# EAGLE design birthday-countdown-clock (EAGLE 9.7.0)
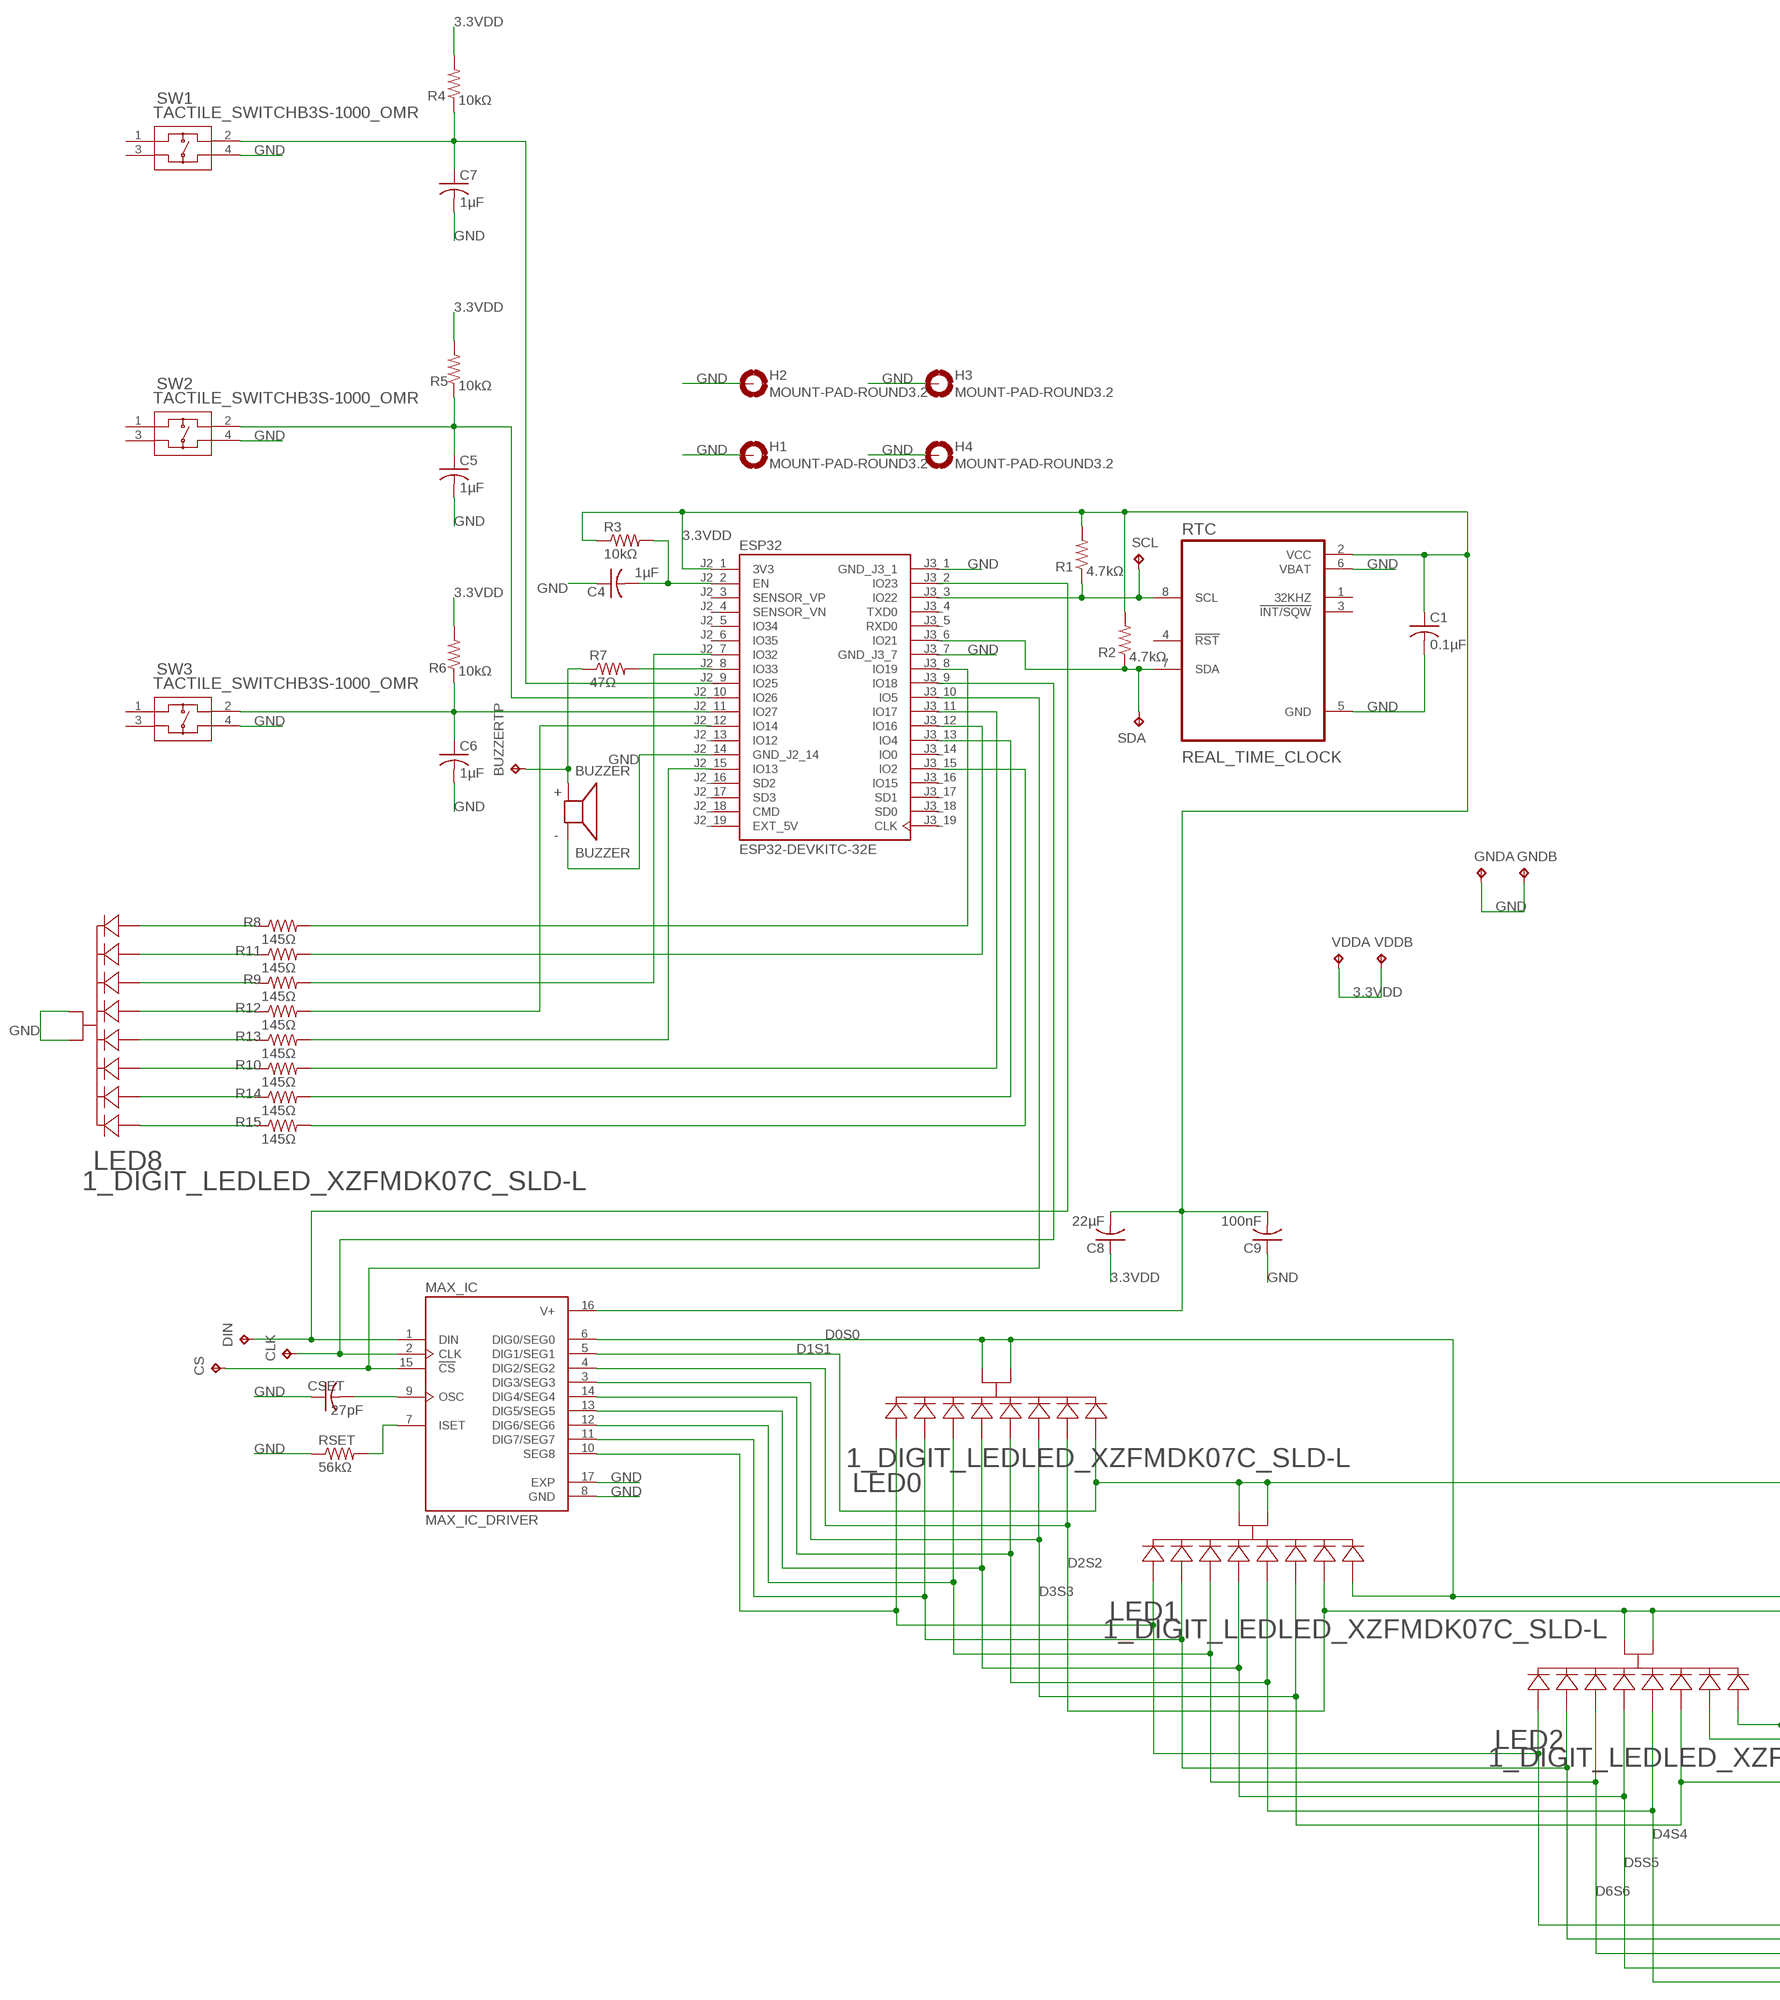
[diagram p0: schematic, sheet 1, part 1 of 2]
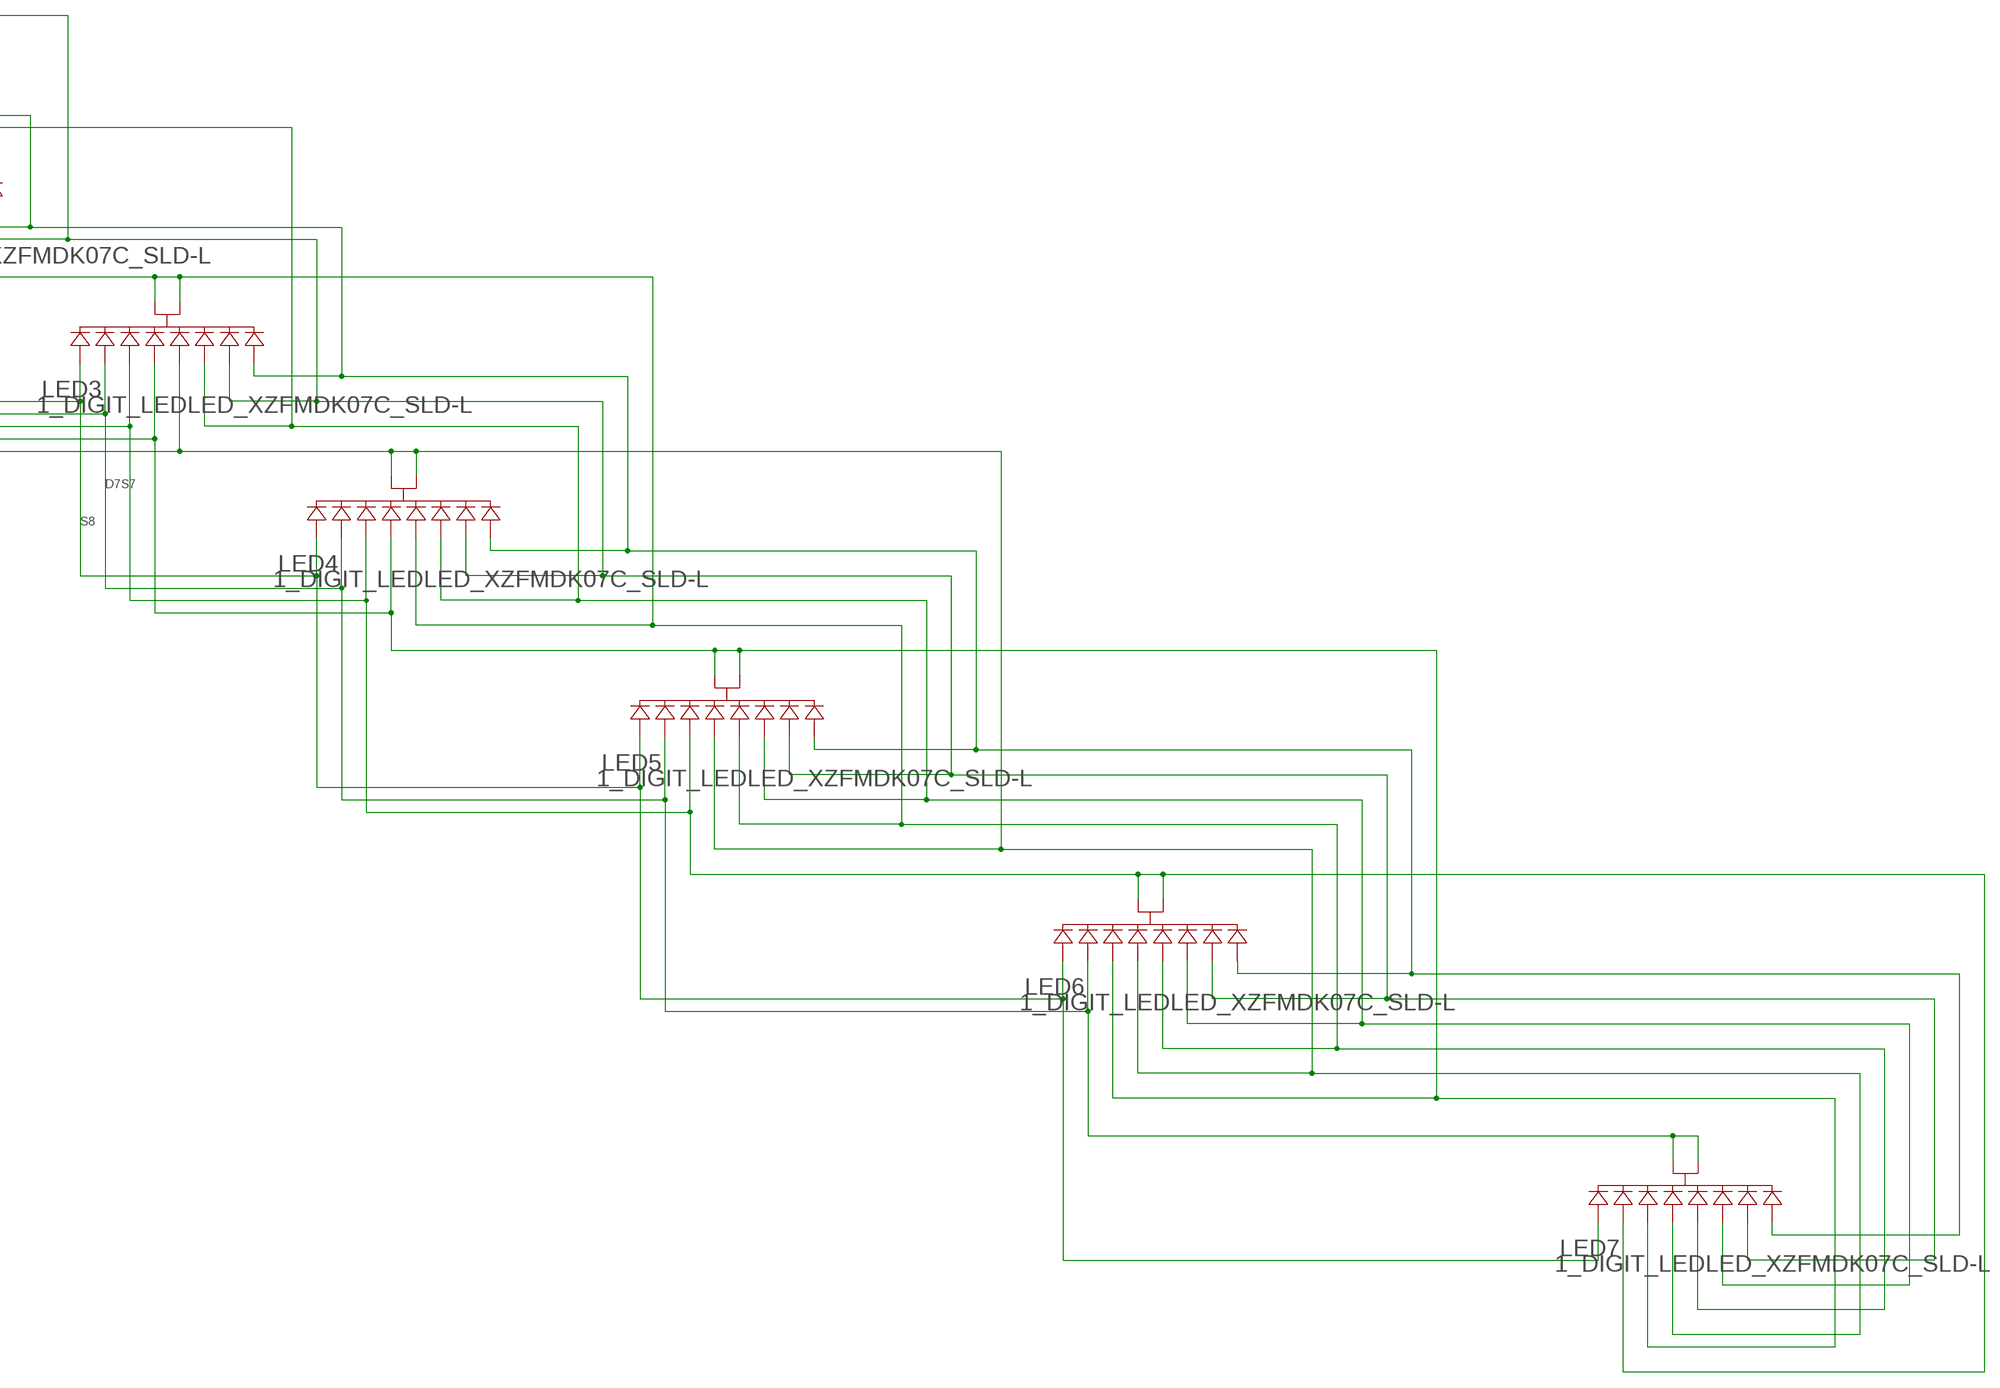
[diagram p1: schematic, sheet 1, part 2 of 2]

## Parts
BUZZER  BUZZER  [XDCR_SMTB-0927-TW-R]
BUZZERTP  TPTP20SQ  [TP20SQ]
C1  0.1µF  C-USC0805  [C0805]
C4  1µF  C-USC0805  [C0805]
C5  1µF  C-USC0805  [C0805]
C6  1µF  C-USC0805  [C0805]
C7  1µF  C-USC0805  [C0805]
C8  22µF  C-USC0805  [C0805]
C9  100nF  C-USC0805  [C0805]
CLK  TPTP20SQ  [TP20SQ]
CS  TPTP20SQ  [TP20SQ]
CSET  27pF  C-USC0805  [C0805]
DIN  TPTP20SQ  [TP20SQ]
ESP32  ESP32-DEVKITC-32E  [MODULE_ESP32-DEVKITC-32E]
GND  TP2P2-38-20  [P2-38-20]
H1  MOUNT-PAD-ROUND3.2  [3,2-PAD]
H2  MOUNT-PAD-ROUND3.2  [3,2-PAD]
H3  MOUNT-PAD-ROUND3.2  [3,2-PAD]
H4  MOUNT-PAD-ROUND3.2  [3,2-PAD]
LED0  1_DIGIT_LEDLED_XZFMDK07C_SLD-L  [LED_XZFMDK07C_SLD-L]
LED1  1_DIGIT_LEDLED_XZFMDK07C_SLD-L  [LED_XZFMDK07C_SLD-L]
LED2  1_DIGIT_LEDLED_XZFMDK07C_SLD-L  [LED_XZFMDK07C_SLD-L]
LED3  1_DIGIT_LEDLED_XZFMDK07C_SLD-L  [LED_XZFMDK07C_SLD-L]
LED4  1_DIGIT_LEDLED_XZFMDK07C_SLD-L  [LED_XZFMDK07C_SLD-L]
LED5  1_DIGIT_LEDLED_XZFMDK07C_SLD-L  [LED_XZFMDK07C_SLD-L]
LED6  1_DIGIT_LEDLED_XZFMDK07C_SLD-L  [LED_XZFMDK07C_SLD-L]
LED7  1_DIGIT_LEDLED_XZFMDK07C_SLD-L  [LED_XZFMDK07C_SLD-L]
LED8  1_DIGIT_LEDLED_XZFMDK07C_SLD-L  [LED_XZFMDK07C_SLD-L]
MAX_IC  MAX_IC_DRIVER  [SOP63P602X173-17N]
R1  4.7kΩ  R-US_R0805  [R0805]
R2  4.7kΩ  R-US_R0805  [R0805]
R3  10kΩ  R-US_R0805  [R0805]
R4  10kΩ  R-US_R0805  [R0805]
R5  10kΩ  R-US_R0805  [R0805]
R6  10kΩ  R-US_R0805  [R0805]
R7  47Ω  R-US_R0805  [R0805]
R8  145Ω  R-US_R0805  [R0805]
R9  145Ω  R-US_R0805  [R0805]
R10  145Ω  R-US_R0805  [R0805]
R11  145Ω  R-US_R0805  [R0805]
R12  145Ω  R-US_R0805  [R0805]
R13  145Ω  R-US_R0805  [R0805]
R14  145Ω  R-US_R0805  [R0805]
R15  145Ω  R-US_R0805  [R0805]
RSET  56kΩ  R-US_R0805  [R0805]
RTC  REAL_TIME_CLOCK  [SOIC127P600X175-8N]
SCL  TPTP20SQ  [TP20SQ]
SDA  TPTP20SQ  [TP20SQ]
SW1  TACTILE_SWITCHB3S-1000_OMR  [B3S-1000_OMR]
SW2  TACTILE_SWITCHB3S-1000_OMR  [B3S-1000_OMR]
SW3  TACTILE_SWITCHB3S-1000_OMR  [B3S-1000_OMR]
VDD  TP2P2-38-20  [P2-38-20]

## Nets
3.3VDD [power]: C1.1 C8.1 C8.2 C9.2 ESP32.J2_1(3V3) MAX_IC.16(V+) R1.2 R2.2 R3.1 R4.2 R5.2 R6.2 RTC.2(VCC) VDD.TP-1 VDD.TP-2
D0S0: LED0.3 LED0.8 LED1.5 LED2.5 LED3.5 LED4.5 LED5.5 LED6.5 LED7.5 MAX_IC.6(DIG0/SEG0)
D1S1: LED0.5 LED1.3 LED1.8 LED2.10 LED3.10 LED4.10 LED5.10 LED6.10 LED7.10 MAX_IC.5(DIG1/SEG1)
D2S2: LED0.10 LED1.10 LED2.3 LED2.8 LED3.9 LED4.9 LED5.9 LED6.9 LED7.9 MAX_IC.4(DIG2/SEG2)
D3S3: LED0.9 LED1.9 LED2.9 LED3.3 LED3.8 LED4.1 LED5.1 LED6.1 LED7.1 MAX_IC.3(DIG3/SEG3)
D4S4: LED0.1 LED1.1 LED2.1 LED3.1 LED4.3 LED4.8 LED5.2 LED6.2 LED7.2 MAX_IC.14(DIG4/SEG4)
D5S5: LED0.2 LED1.2 LED2.2 LED3.2 LED4.2 LED5.3 LED5.8 LED6.4 LED7.4 MAX_IC.13(DIG5/SEG5)
D6S6: LED0.4 LED1.4 LED2.4 LED3.4 LED4.4 LED5.4 LED6.3 LED6.8 LED7.6 MAX_IC.12(DIG6/SEG6)
D7S7: LED0.6 LED1.6 LED2.6 LED3.6 LED4.6 LED5.6 LED6.6 LED7.3 LED7.8 MAX_IC.11(DIG7/SEG7)
GND [GND]: BUZZER.N(-) C1.2 C4.1 C5.2 C6.2 C7.2 C9.1 CSET.1 ESP32.J2_14(GND_J2_14) ESP32.J3_1(GND_J3_1) ESP32.J3_7(GND_J3_7) GND.TP-1 GND.TP-2 H1.B3,2(MOUNT) H2.B3,2(MOUNT) H3.B3,2(MOUNT) H4.B3,2(MOUNT) LED8.3 LED8.8 MAX_IC.8(GND) MAX_IC.17(EXP) RSET.1 RTC.5(GND) RTC.6(VBAT) SW1.4 SW2.4 SW3.4
N$1: ESP32.J3_6(IO21) R2.1 RTC.7(SDA) SDA.TP
N$2: ESP32.J3_3(IO22) R1.1 RTC.8(SCL) SCL.TP
N$3: MAX_IC.7(ISET) RSET.2
N$4: CLK.TP ESP32.J3_9(IO18) MAX_IC.2(CLK)
N$5: CS.TP ESP32.J3_10(IO5) MAX_IC.15(!CS)
N$6: CSET.2 MAX_IC.9(OSC)
N$7: C4.2 ESP32.J2_2(EN) R3.2
N$8: LED8.5 R8.1
N$9: ESP32.J3_15(IO2) R15.2
N$11: BUZZER.P(+) BUZZERTP.TP R7.1
N$12: DIN.TP ESP32.J3_2(IO23) MAX_IC.1(DIN)
N$13: ESP32.J2_8(IO33) R7.2
N$14: ESP32.J3_13(IO4) R14.2
N$15: ESP32.J3_11(IO17) R10.2
N$16: ESP32.J2_15(IO13) R13.2
N$17: ESP32.J2_12(IO14) R12.2
N$18: ESP32.J2_7(IO32) R9.2
N$19: ESP32.J3_12(IO16) R11.2
N$20: ESP32.J3_8(IO19) R8.2
N$21: LED8.10 R11.1
N$22: LED8.9 R9.1
N$23: LED8.1 R12.1
N$24: LED8.2 R13.1
N$25: LED8.4 R10.1
N$26: LED8.6 R14.1
N$27: LED8.7 R15.1
N$32: C5.1 ESP32.J2_10(IO26) R5.1 SW2.2
N$33: C6.1 ESP32.J2_11(IO27) R6.1 SW3.2
N$34: C7.1 ESP32.J2_9(IO25) R4.1 SW1.2
S8: LED0.7 LED1.7 LED2.7 LED3.7 LED4.7 LED5.7 LED6.7 LED7.7 MAX_IC.10(SEG8)
Unconnected: ESP32.J2_3(SENSOR_VP) ESP32.J2_4(SENSOR_VN) ESP32.J2_5(IO34) ESP32.J2_6(IO35) ESP32.J2_13(IO12) ESP32.J2_16(SD2) ESP32.J2_17(SD3) ESP32.J2_18(CMD) ESP32.J3_4(TXD0) ESP32.J3_5(RXD0) ESP32.J3_14(IO0) ESP32.J3_16(IO15) ESP32.J3_17(SD1) ESP32.J3_18(SD0) ESP32.J3_19(CLK) RTC.1(32KHZ) RTC.3(!INT/SQW) RTC.4(!RST) SW1.1 SW1.3 SW2.1 SW2.3 SW3.1 SW3.3

## Power pins joined to a net without a drawn wire
EXT_5V: ESP32.J2_19(EXT_5V)

## Library data of the parts
BUZZER = Birthday Countdown Library:BUZZER; MANUFACTURER: Pui Audio; MAXIMUM_PACKAGE_HEIGHT: 4.8 mm; PARTREV: 6/1/17; STANDARD: Manufacturer Recommendations
BUZZERTP CLK CS DIN SCL SDA = testpad:TP: Test pad
C1 C4-C9 CSET = rcl:C-US: CAPACITOR, American symbol; SPICEPREFIX: C
ESP32 = Birthday Countdown Library:ESP32-DEVKITC-32E; MANUFACTURER: Espressif Systems; PARTREV: 1.4; STANDARD: Manufacturer Recommendations
GND VDD = testpad:TP2: Test pad
H1-H4 = holes:MOUNT-PAD-ROUND: MOUNTING PAD, round
LED0 LED1-LED8 = Birthday Countdown Library:1_DIGIT_LED; COPYRIGHT: Copyright (C) 2024 Ultra Librarian. All rights reserved.; MANUFACTURER_PART_NUMBER: XZFMDK07C; MFR_NAME: SunLED
MAX_IC = Birthday Countdown Library:MAX_IC_DRIVER; MANUFACTURER: Analog Devices; MAXIMUM_PACKAGE_HEIGHT: 1.73mm; PARTREV: 2; STANDARD: IPC-7351B
R1-R15 RSET = rcl:R-US_: RESISTOR, American symbol; SPICEPREFIX: R
RTC = Birthday Countdown Library:REAL_TIME_CLOCK
SW1-SW3 = Birthday Countdown Library:TACTILE_SWITCH; COPYRIGHT: Copyright (C) 2024 Ultra Librarian. All rights reserved.; MANUFACTURER_PART_NUMBER: B3S-1000; MFR_NAME: Omron

## Board
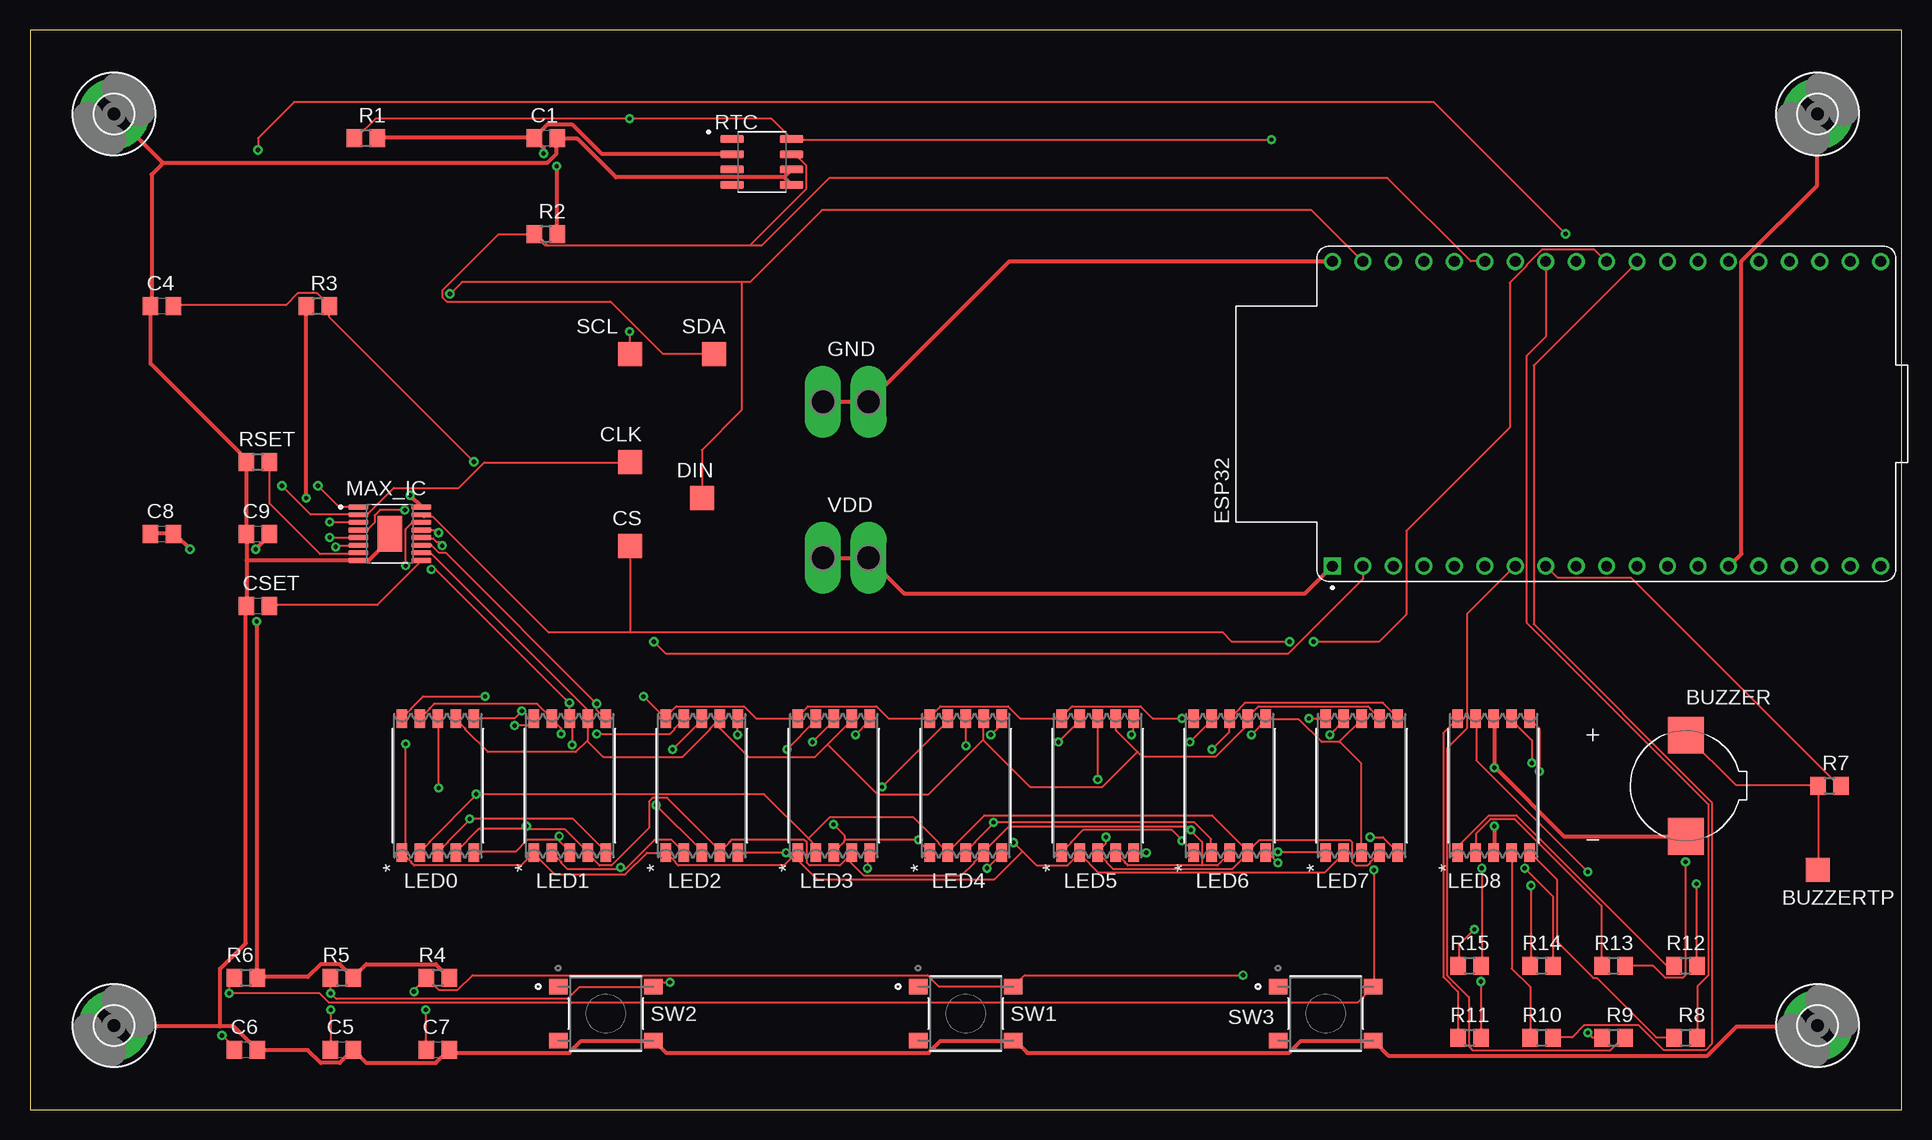
[diagram p2: board, top side]
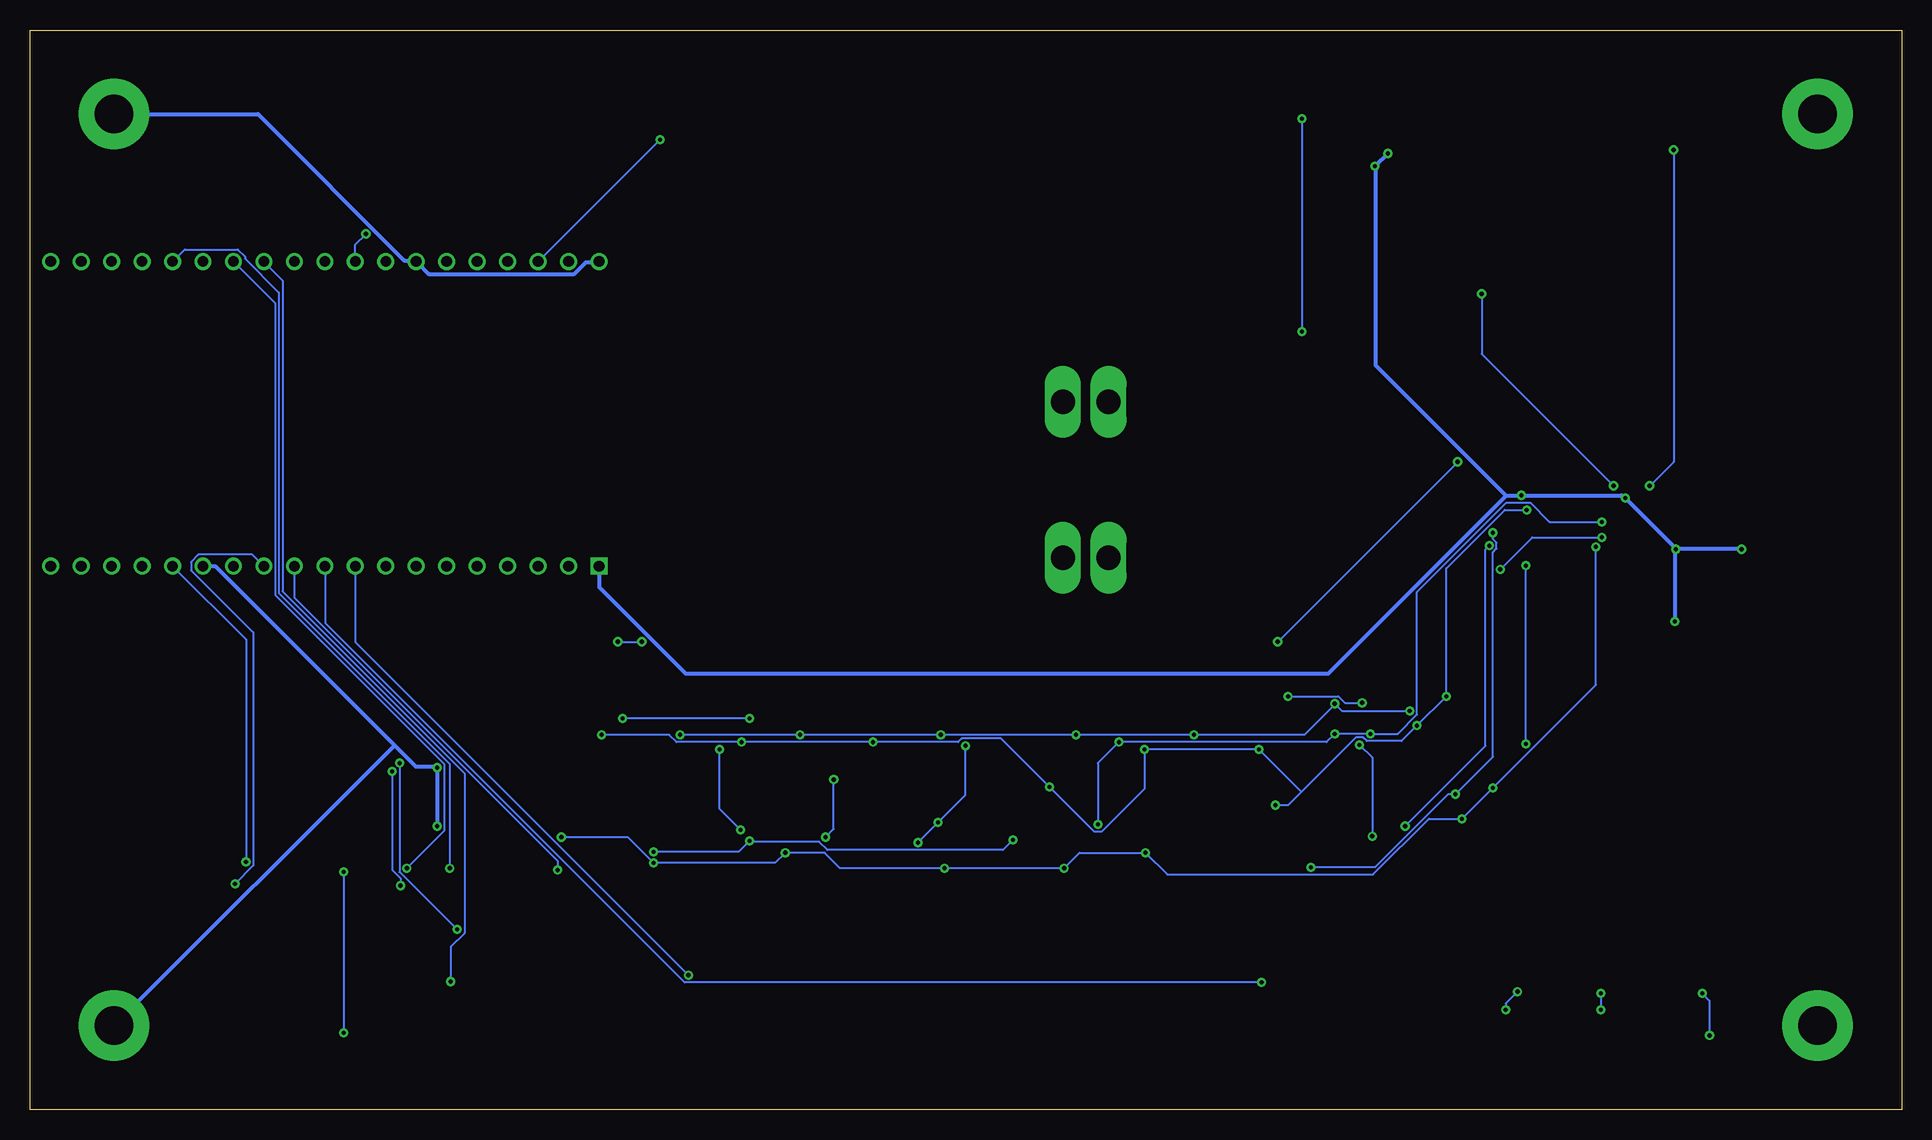
[diagram p3: board, bottom side, seen from below]

Size 156 x 90 mm. Coordinates in mm from the lower left corner, seen from the top.
Outline: 0,0 156,0 156,90 0,90 0,0
Copper layers (1*16): Top 0.035mm / dielectric 1.5mm / Bottom 0.035mm
Design rules "Fusion Electronics Design Rules *": minimum track width 6mil, minimum drill 0.35mm, track to track 6mil, track to pad 6mil, pad to pad 6mil, via to via 6mil, smd to smd 6mil, copper to edge 40mil, drill to drill 6mil, minimum pad ring 10mil, minimum via ring 8mil, stop-mask expansion 4mil, vias tented up to drill 0.4mm, thermal gap 10mil

### Footprints (pad centres in the part's own frame; a part is rotated, then mirrored left to right if it is on the bottom)
XDCR_SMTB-0927-TW-R = smd 3 x 3.05: N 0,-4.225; P 0,4.225
TP20SQ = smd 2 x 2: TP 0,0
C0805 = smd 1.3 x 1.5: 1 -0.95,0; 2 0.95,0
MODULE_ESP32-DEVKITC-32E = drill 0.9 square: J2_1 -12.7,22.835 | drill 0.9: J2_2 -12.7,20.295; J2_3 -12.7,17.755; J2_4 -12.7,15.215; J2_5 -12.7,12.675; J2_6 -12.7,10.135; J2_7 -12.7,7.595; J2_8 -12.7,5.055; J2_9 -12.7,2.515; J2_10 -12.7,-0.025; J2_11 -12.7,-2.565; J2_12 -12.7,-5.105; J2_13 -12.7,-7.645; J2_14 -12.7,-10.185; J2_15 -12.7,-12.725; J2_16 -12.7,-15.265; J2_17 -12.7,-17.805; J2_18 -12.7,-20.345; J2_19 -12.7,-22.885; J3_1 12.7,22.835; J3_2 12.7,20.295; J3_3 12.7,17.755; J3_4 12.7,15.215; J3_5 12.7,12.675; J3_6 12.7,10.135; J3_7 12.7,7.595; J3_8 12.7,5.055; J3_9 12.7,2.515; J3_10 12.7,-0.025; J3_11 12.7,-2.565; J3_12 12.7,-5.105; J3_13 12.7,-7.645; J3_14 12.7,-10.185; J3_15 12.7,-12.725; J3_16 12.7,-15.265; J3_17 12.7,-17.805; J3_18 12.7,-20.345; J3_19 12.7,-22.885
P2-38-20 = drill 2.007 pad 2.54 long: TP-1 -1.905,0; TP-2 1.905,0
3,2-PAD = drill 3.2 pad 5.842: B3,2 0,0
LED_XZFMDK07C_SLD-L = smd 1.549 x 0.889: 1 -5.575,2.997; 2 -5.575,1.499; 3 -5.575,0; 4 -5.575,-1.499; 5 -5.575,-2.997; 6 5.575,-2.997; 7 5.575,-1.499; 8 5.575,0; 9 5.575,1.499; 10 5.575,2.997
SOP63P602X173-17N = smd 1.64 x 0.42: 1 -2.635,2.223; 2 -2.635,1.587; 3 -2.635,0.953; 4 -2.635,0.318; 5 -2.635,-0.318; 6 -2.635,-0.953; 7 -2.635,-1.587; 8 -2.635,-2.223; 9 2.635,-2.223; 10 2.635,-1.587; 11 2.635,-0.953; 12 2.635,-0.318; 13 2.635,0.318; 14 2.635,0.953; 15 2.635,1.587; 16 2.635,2.223 | smd 2.006 x 2.92: 17 0,0
R0805 = smd 1.3 x 1.5: 1 -0.95,0; 2 0.95,0
SOIC127P600X175-8N = smd 1.97 x 0.59: 1 -2.475,1.905; 2 -2.475,0.635; 3 -2.475,-0.635; 4 -2.475,-1.905; 5 2.475,-1.905; 6 2.475,-0.635; 7 2.475,0.635; 8 2.475,1.905
B3S-1000_OMR = smd 1.549 x 1.295: 1 -3.975,2.25; 2 3.975,2.25; 3 -3.975,-2.25; 4 3.975,-2.25

### Placement (x,y rotation side)
BUZZER  138,27 0 top
BUZZERTP  149,20 0 top
C1  43,81 0 top
C4  11,67 0 top
C5  26,5 0 top
C6  18,5 0 top
C7  34,5 0 top
C8  11,48 0 top
C9  19,48 0 top
CLK  50,54 0 top
CS  50,47 0 top
CSET  19,42 0 top
DIN  56,51 0 top
ESP32  131.4,58 90 top
GND  68,59 0 top
H1  7,7 0 top
H2  7,83 0 top
H3  149,83 0 top
H4  149,7 0 top
LED0  34,27 90 top
LED1  45,27 90 top
LED2  56,27 90 top
LED3  67,27 90 top
LED4  78,27 90 top
LED5  89,27 90 top
LED6  100,27 90 top
LED7  111,27 90 top
LED8  122,27 90 top
MAX_IC  30,48 0 top
R1  28,81 0 top
R2  43,73 0 top
R3  24,67 0 top
R4  34,11 0 top
R5  26,11 0 top
R6  18,11 0 top
R7  150,27 0 top
R8  138,6 0 top
R9  132,6 0 top
R10  126,6 0 top
R11  120,6 0 top
R12  138,12 0 top
R13  132,12 0 top
R14  126,12 0 top
R15  120,12 0 top
RSET  19,54 0 top
RTC  61,79 0 top
SCL  50,63 0 top
SDA  57,63 0 top
SW1  78,8 0 top
SW2  48,8 0 top
SW3  108,8 0 top
VDD  68,46 0 top

### Tracks (layer width: path | path; a pad name or v marks a point on that pad's centre or on a via)
3.3VDD  (via drill 0.35)
  Top 0.35: R1.2 41.99,81 C1.1 | v43.89,78.64 43.89,73.08 R2.2 | v42.82,79.7 42.82,80.16 42.14,80.85 C1.1 | RTC.2 58.52,79.7 47.62,79.7 45.19,82.14 43.13,82.14 42.14,81.15 C1.1 | R4.2 34.9,11.05 33.83,12.12 28.04,12.12 27.05,11.12 R5.2 26.9,11.05 25.83,12.12 24.23,12.12 23.16,11.05 18.97,11.05 R6.2 18.9,11.2 v18.9,40.69 | C8.1 11.89,48.01 C8.2 12.12,47.93 v13.34,46.71 | v18.82,46.71 19.89,47.78 19.89,47.93 C9.2 | v23.01,50.98 23.01,66.98 R3.1 | v31.7,51.21 32.61,50.29 MAX_IC.16 | ESP32.J2_1 108.51,45.26 106.28,43.03 72.87,43.03 VDD.TP-2 VDD.TP-1
  Bottom 0.35: v42.82,79.7 v43.89,78.64 43.81,78.49 43.81,62.03 33.07,51.28 32.99,51.13 | v13.34,46.71 v18.82,46.71 | v18.82,46.71 18.9,46.86 v23.01,50.98 23.16,51.05 23.32,51.21 v31.7,51.21 31.85,51.13 32.99,51.13 | 32.99,51.13 47.79,36.34 101.34,36.34 108.56,43.56 ESP32.J2_1 | v18.9,40.69 18.9,46.56 v18.82,46.71
D0S0  (via drill 0.35)
  Top 0.152: 36.69,24.19 36.73,24.23 45.26,24.23 48.01,21.49 LED1.5 | 36.69,24.19 34.82,22.33 34.82,22.25 34.06,21.49 LED0.3 | v34.06,26.82 34.06,32.54 LED0.8 | v36.65,24.23 36.69,24.19 | v63.02,21.41 59.05,21.41 LED2.5 | v69.8,20.12 69.8,21.26 69.95,21.41 LED3.5 | v79.78,20.12 80.92,21.26 80.92,21.41 LED4.5 | v93.04,21.41 92.05,21.41 LED5.5 | v104.01,20.57 103.17,21.41 103.02,21.41 LED6.5 | v111.71,22.71 112.78,22.71 114,21.49 LED7.5 | MAX_IC.6 27.33,47.02 25.58,47.02 v25.48,46.91
  Bottom 0.152: v111.71,22.71 106.15,22.71 v104.01,20.57 93.88,20.57 v93.04,21.41 89.76,21.41 88.47,20.12 v79.78,20.12 v69.8,20.12 68.5,21.41 v63.02,21.41 61.19,19.58 44.04,19.58 39.4,24.23 v36.65,24.23 v34.06,26.82 25.48,35.41 v25.48,46.91
D1S1  (via drill 0.35)
  Top 0.152: 44.08,22.44 45.03,21.49 LED1.3 | 44.08,22.44 44.04,22.48 41.45,22.48 40.46,21.49 37.03,21.49 LED0.5 | v51.13,34.44 52.96,32.61 LED2.10 52.96,32.69 53.87,33.6 59.51,33.6 60.5,32.61 63.93,32.61 LED3.10 63.93,32.69 64.85,33.6 70.56,33.6 71.55,32.61 74.98,32.61 LED4.10 74.98,32.69 75.89,33.6 81.53,33.6 82.53,32.61 85.95,32.61 LED5.10 85.95,32.69 86.87,33.6 92.58,33.6 93.57,32.61 v96.01,32.61 97,32.61 LED6.10 | v106.6,32.61 107.97,32.61 LED7.10 | v24.98,47.7 27.36,47.7 MAX_IC.5 | v33.45,45.03 33.83,45.03 v44.96,33.91 44.96,32.61 LED1.8 45.03,32.54 45.19,32.38 v45.19,30.4 | v44.12,22.78 44.12,22.48 44.08,22.44
  Bottom 0.152: v44.96,33.91 46.41,33.91 46.94,34.44 v51.13,34.44 | v96.01,32.61 v106.6,32.61 | v24.98,47.7 30.79,47.7 v33.45,45.03 | v44.12,22.78 44.12,29.34 v45.19,30.4
D2S2  (via drill 0.35)
  Top 0.152: v37.95,34.44 32.77,34.44 31.77,33.45 31.77,33.38 31.01,32.61 LED0.10 | v40.39,32 41.45,32 41.99,32.54 LED1.10 | v52.2,25.38 55.93,21.64 55.93,21.49 LED2.3 | v53.57,30.02 55.93,32.38 55.93,32.54 LED2.8 | v63.09,30.02 65.46,32.38 65.46,32.54 LED3.9 | v71.02,26.9 76.43,32.31 76.43,32.54 LED4.9 | v85.72,30.63 87.48,32.38 87.48,32.54 LED5.9 | v96.7,30.63 98.45,32.38 98.45,32.54 LED6.9 | v108.36,31.24 109.5,32.38 109.5,32.54 LED7.9 | v31.24,49.99 29.18,49.99 28.73,49.53 28.73,48.92 28.19,48.39 27.43,48.39 MAX_IC.4
  Bottom 0.152: v52.2,25.38 51.13,25.38 50.02,26.48 | 50.02,26.48 45.49,31.01 44.88,31.01 44.58,30.71 41.68,30.71 v40.39,32 v37.95,34.44 37.95,45.11 33.07,49.99 v31.24,49.99 | 50.02,26.48 v53.57,30.02 v63.09,30.02 63.09,26.75 66.67,23.16 67.28,23.16 v71.02,26.9 75.06,30.94 78.33,30.94 78.64,30.63 v85.72,30.63 v96.7,30.63 102.11,30.63 102.72,31.24 v108.36,31.24
D3S3  (via drill 0.35)
  Top 0.152: 96.05,22.44 97,21.49 LED6.1 | 96.05,22.44 95.17,23.32 87.78,23.32 86.79,22.33 86.79,22.25 86.03,21.49 LED5.1 | v104.01,21.49 107.97,21.49 LED7.1 | v96.01,22.4 96.05,22.44 | 67.93,22.44 67.97,22.48 73.99,22.48 74.03,22.44 | 67.93,22.44 67.82,22.33 67.82,22.25 67.06,21.49 LED3.3 | 74.03,22.44 74.98,21.49 LED4.1 | LED0.9 32.54,32.61 33.3,33.38 33.3,33.45 33.68,33.83 42.29,33.83 43.51,32.61 LED1.9 43.51,32.54 44.27,31.77 v44.27,31.32 | v47.24,31.32 53.34,31.32 53.72,31.7 53.72,31.77 54.48,32.54 LED2.9 | v65.23,30.63 66.98,32.38 66.98,32.54 LED3.8 | v66.98,23.77 67.89,22.86 67.89,22.48 67.93,22.44 | v74.07,22.48 74.03,22.44 | v24.98,48.98 27.34,48.98 MAX_IC.3
  Bottom 0.152: v104.01,21.49 96.93,21.49 v96.01,22.4 96.01,22.33 90.22,22.33 89.53,21.64 74.91,21.64 v74.07,22.48 | v66.98,23.77 66.98,28.88 v65.23,30.63 47.93,30.63 v47.24,31.32 v44.27,31.32 41.99,31.32 40.39,32.92 40.39,43.13 32.92,50.6 30.94,50.6 29.34,49 25,49 v24.98,48.98
D4S4  (via drill 0.35)
  Top 0.152: LED7.2 109.58,21.41 107.9,19.74 89.08,19.74 87.55,21.26 87.55,21.41 LED5.2 87.55,21.18 87.33,21.18 86.49,20.34 83.9,20.34 82.72,21.53 | 80.35,23.89 80.39,23.93 97.08,23.93 98.45,22.55 98.45,21.49 LED6.2 | 80.35,23.89 78.79,22.33 78.79,22.25 78.03,21.49 LED4.3 | v78.03,30.33 78.03,32.54 LED4.8 | v80.31,23.93 80.35,23.89 | v81.99,22.25 82.72,21.53 | v31.32,45.34 31.32,48.39 31.85,48.92 32.61,48.92 MAX_IC.14 | v31.32,30.48 31.32,21.79 31.01,21.49 LED0.1 31.01,21.41 31.77,20.65 31.77,20.57 32,20.34 40.92,20.34 41.99,21.41 LED1.1 41.99,21.34 43.74,19.58 49.61,19.58 51.44,21.41 52.96,21.41 LED2.1 53.03,21.41 53.8,20.65 53.8,20.57 54.03,20.34 62.87,20.34 63.93,21.41 LED3.1 63.7,21.11 65.61,19.2 80.39,19.2 82.72,21.53
  Bottom 0.152: v78.03,30.33 78.03,26.21 v80.31,23.93 v81.99,22.25 | v31.32,30.48 v31.32,45.34
D5S5  (via drill 0.35)
  Top 0.152: LED6.4 101.58,21.41 100.2,20.04 90.3,20.04 89.76,20.57 89.76,20.65 LED5.3 89,21.49 89.69,22.17 v89.69,22.71 | v89,27.51 89,32.54 LED5.8 | LED7.4 112.47,21.41 111.71,20.65 111.71,20.57 111.48,20.34 110.49,20.34 110.19,20.65 110.19,22.33 110.03,22.48 102.49,22.48 101.5,21.49 LED6.4 | 49.23,20.04 49.61,20.04 52.05,22.48 53.49,22.48 54.48,21.49 LED2.2 | 49.23,20.04 44.81,20.04 44.27,20.57 44.27,20.65 LED1.2 | 37.22,26.25 37.26,26.29 61.19,26.29 64.88,22.59 | 37.22,26.25 33.3,22.33 33.3,22.25 32.54,21.49 LED0.2 | 64.88,22.59 65.46,22.02 65.46,21.49 LED3.2 | 64.88,22.59 66.67,24.38 73.61,24.38 75.74,22.25 75.74,22.17 76.43,21.49 LED4.2 76.5,21.49 79.55,24.54 98.53,24.54 101.5,21.57 LED6.4 | v34.06,48.08 33.83,48.31 32.69,48.31 MAX_IC.13 | v37.19,26.29 37.22,26.25 | v49.23,20.19 49.23,20.04
  Bottom 0.152: v89,27.51 89,23.39 v89.69,22.71 | v49.23,20.19 43.89,20.19 37.8,26.29 v37.19,26.29 34.06,29.41 34.06,46.45 33.75,46.76 33.75,47.26 34.06,47.57 v34.06,48.08
D6S6  (via drill 0.35)
  Top 0.152: 41.38,23.39 44.58,23.39 46.48,21.49 LED1.4 46.56,21.41 46.56,21.26 47.47,20.34 48.46,20.34 51.59,23.47 51.59,25.68 51.89,25.98 53.11,25.98 57.53,21.57 LED2.4 57.53,21.49 58.29,22.25 58.29,22.33 58.45,22.48 64.54,22.48 64.77,22.25 64.77,20.57 65,20.34 67.51,20.34 68.43,21.26 68.43,21.41 LED3.4 68.12,20.88 69.49,19.51 77.65,19.51 78.72,20.57 78.72,20.65 79.48,21.41 LED4.4 79.48,21.49 81.61,23.62 96.39,23.62 96.74,23.28 | 41.38,23.39 37.41,23.39 35.51,21.49 LED0.4 | 41.38,23.39 v41.38,23.62 | MAX_IC.12 32.69,47.62 33.6,47.62 33.91,47.32 34.04,47.32 v34.36,47.01 | LED7.6 114.07,32.61 112.78,33.91 101.27,33.91 100.81,33.45 100.81,33.38 100.05,32.61 LED6.8 99.97,32.54 99.97,31.47 v98.53,30.02 | 97.69,20.34 98.98,20.34 100.05,21.41 LED6.3 | 97.69,20.34 91.52,20.34 91.29,20.57 91.29,20.65 90.53,21.41 LED5.4 | 97.69,20.34 97.69,22.33 96.74,23.28 | v96.77,23.32 96.74,23.28
  Bottom 0.152: v41.38,23.62 34.67,30.33 34.67,46.69 v34.36,47.01 | v98.53,30.02 98.53,25.07 v96.77,23.32
D7S7  (via drill 0.35)
  Top 0.152: 109.16,30.67 111.02,32.54 LED7.8 | 109.16,30.67 109.12,30.63 107.67,30.63 105.77,32.54 103.02,32.54 LED6.6 103.02,32.46 v101.8,31.24 | 109.16,30.67 110.95,28.88 110.95,21.49 LED7.3 | v41,33.22 40.39,32.61 37.03,32.61 LED0.6 | LED1.6 47.93,32.61 47.24,33.3 v47.24,33.83 34.68,46.4 34.11,46.4 33.49,47.02 32.67,47.02 MAX_IC.11 | v58.98,31.24 58.98,32.54 LED2.6 | v68.81,31.24 69.95,32.38 69.95,32.54 LED3.6 | v80.09,31.24 80.92,32.08 80.92,32.54 LED4.6 | v91.82,31.24 91.97,31.39 91.97,32.54 LED5.6
  Bottom 0.152: v41,33.22 46.63,33.22 v47.24,33.83 47.24,33.76 49.76,31.24 v58.98,31.24 v68.81,31.24 v80.09,31.24 v91.82,31.24 v101.8,31.24
GND  (via drill 0.35)
  Top 0.35: v122.07,23.62 122.07,21.49 LED8.3 | LED8.8 122.07,32.54 v122.07,28.5 122.22,28.42 127.86,22.78 138,22.78 BUZZER.N | H3.B3,2 148.97,82.98 148.97,77.04 142.65,70.71 142.65,46.33 141.66,45.34 ESP32.J2_14 | MAX_IC.17 29.95,47.93 29.95,47.47 28.27,45.8 27.43,45.8 MAX_IC.8 27.2,45.8 18.06,45.8 | 18.06,45.8 18.06,47.93 C9.1 18.06,48.16 18.06,53.95 RSET.1 18.06,54.18 10.06,62.18 10.06,66.98 C4.1 10.13,67.13 10.13,77.95 10.97,78.79 11.05,78.94 | 18.06,45.8 18.06,42.06 CSET.1 17.98,41.83 17.98,13.87 15.85,11.73 15.85,6.93 | 62.87,77.72 48.84,77.72 45.64,80.92 43.97,80.92 C1.2 43.89,80.77 43.89,79.7 43.13,78.94 11.05,78.94 | 62.87,77.72 63.48,78.33 RTC.6 | 62.87,77.72 63.48,77.11 RTC.5 | 11.05,78.94 7.01,82.98 H2.B3,2 | 15.85,6.93 16.99,6.93 18.82,5.11 C6.2 18.97,4.95 23.16,4.95 24.23,3.89 25.83,3.89 26.9,4.95 C5.2 27.05,4.88 28.04,3.89 33.83,3.89 34.9,4.95 C7.2 35.05,4.88 35.2,4.72 44.96,4.72 45.95,5.71 51.97,5.71 SW2.4 52.12,5.64 53.03,4.72 74.91,4.72 75.89,5.71 81.92,5.71 SW1.4 82.14,5.71 83.13,4.72 104.93,4.72 105.92,5.71 111.94,5.71 SW3.4 112.09,5.64 113.23,4.5 139.83,4.5 142.26,6.93 148.97,6.93 H4.B3,2 | 15.85,6.93 7.01,6.93 H1.B3,2 | ESP32.J3_1 81.61,70.7 GND.TP-2 69.8,58.98 66.14,58.98 GND.TP-1
  Bottom 0.35: ESP32.J3_1 108.58,70.64 109.65,70.64 110.64,69.65 122.76,69.65 123.75,70.64 ESP32.J3_7 123.9,70.79 124.79,70.79 136.98,82.98 148.97,82.98 H3.B3,2 | v122.07,23.62 v122.07,28.5 122.22,28.57 123.83,28.57 125.62,30.37 | 125.62,30.37 140.51,45.26 141.58,45.26 ESP32.J2_14 | 125.62,30.37 148.97,7.01 H4.B3,2
N$1
  Top 0.152: 63.78,79.63 63.55,79.63 RTC.7 63.78,79.63 | R2.1 42.06,73 42.22,73 43.2,72.01 60.97,72.01 66.62,77.66 113.15,77.66 120.09,70.71 121.23,70.71 ESP32.J3_6 | 63.78,79.63 64.69,78.72 64.69,76.75 59.96,72.02 42.93,72.02 42.05,72.9 R2.1 | SDA.TP 57,63.02 52.73,63.02 48.39,67.36 34.75,67.36 34.37,67.74 34.37,68.28 39.01,72.92 41.99,72.92 R2.1
N$2  (via drill 0.35)
  Top 0.152: R1.1 27.2,81 28.8,82.6 v49.99,82.6 61.8,82.6 63.48,80.92 RTC.8 63.55,80.85 v103.48,80.85 | v49.99,64.85 49.99,63.02 SCL.TP
  Bottom 0.152: v103.48,80.85 113.61,70.71 ESP32.J3_3 | v49.99,82.6 v49.99,64.85
N$3
  Top 0.152: RSET.2 19.96,53.95 19.96,50.51 24.17,46.3 27.26,46.3 MAX_IC.7
N$4  (via drill 0.35)
  Top 0.152: v19,80 19,81 22,84 117,84 v128,73 | v21,52 23.41,49.59 MAX_IC.2 27.43,49.61 28.12,49.61 30.33,51.82 35.74,51.82 37.87,53.95 49.99,53.95 CLK.TP
  Bottom 0.152: v19,80 19,54 v21,52 | ESP32.J3_9 128.88,72.12 v128,73
N$5  (via drill 0.35)
  Top 0.152: ESP32.J3_10 131.37,70.71 130.38,71.7 126.03,71.7 124.73,70.41 124.73,70.31 123.35,68.93 123.35,56.87 114.71,48.23 114.71,41.29 112.43,39 v107,39 | MAX_IC.15 32.83,49.39 33.61,49.39 43.24,39.76 50.06,39.76 | v105,39 100.2,39 99.44,39.76 50.06,39.76 | 50.06,39.76 50.06,46.94 CS.TP
  Bottom 0.152: v107,39 v105,39
N$6
  Top 0.152: CSET.2 19.96,42.06 28.96,42.06 32.61,45.72 MAX_IC.9
N$7  (via drill 0.35)
  Top 0.152: C4.2 11.96,67.06 21.34,67.06 22.33,68.05 23.93,68.05 24.92,67.06 R3.2 24.95,66.05 v37,54 | v52,39 53,38 104.86,38 111.1,44.24 ESP32.J2_2
  Bottom 0.152: v52,39 v37,54
N$8
  Top 0.152: R8.1 137.01,6.02 135.56,6.02 130.61,10.97 130.3,10.97 127.25,14.02 127.25,19.2 125.04,21.41 LED8.5
N$9  (via drill 0.35)
  Top 0.152: v121.01,20.12 121.01,12.04 R15.2
  Bottom 0.152: v121.01,20.12 121.01,28.8 135.25,43.05 135.25,68.12 138.07,70.94 138.07,71.09 138.68,71.7 143.1,71.7 144.09,70.71 ESP32.J3_15
N$11
  Top 0.152: BUZZER.P 138.07,31.17 142.19,27.05 149.05,27.05 R7.1 149.05,26.98 149.05,20.04 BUZZERTP.TP
N$12  (via drill 0.35)
  Top 0.152: ESP32.J3_2 106.8,75 66,75 60,69 59.29,69 | 59.29,69 36,69 v35,68 | MAX_IC.1 25.78,50.22 v24,52 | 59.29,69 59.29,58.29 56,55 DIN.TP
  Bottom 0.152: v35,68 35,63 v24,52
N$13
  Top 0.152: R7.2 150.88,27.05 150.72,27.05 133.43,44.35 127.33,44.35 126.42,45.26 ESP32.J2_8
N$14  (via drill 0.35)
  Top 0.152: v124.59,20.12 126.95,17.75 126.95,12.04 R14.2
  Bottom 0.152: v124.59,20.12 121.46,23.24 121.46,28.8 135.56,42.9 135.56,67.21 138.99,70.64 ESP32.J3_13
N$15
  Top 0.152: R10.2 127.03,6.02 128.55,6.02 129.54,7.01 134.11,7.01 136.17,4.95 139.68,4.95 140.21,5.49 140.21,25.6 125.35,40.46 125.35,62.03 133.96,70.64 ESP32.J3_11
N$16  (via drill 0.35)
  Top 0.152: v138,20.65 138,11.2 137.77,10.97 136.32,10.97 135.33,11.96 132.97,11.96 R13.2
  Bottom 0.152: v138,20.65 138,39.17 144.09,45.26 ESP32.J2_15
N$17  (via drill 0.35)
  Top 0.152: v138.91,18.82 138.91,12.04 R12.2
  Bottom 0.152: v138.91,18.82 137.39,20.34 137.39,39.78 142.57,44.96 142.57,45.64 141.96,46.25 137.47,46.25 136.55,45.34 ESP32.J2_12
N$18
  Top 0.152: R9.2 132.89,5.94 132.74,5.94 131.75,4.95 120.24,4.95 119.94,5.26 119.94,9.37 118.11,11.2 118.11,30.1 119.79,31.77 119.79,41.3 123.75,45.26 ESP32.J2_7
N$19  (via drill 0.35)
  Top 0.152: v120.93,10.67 120.93,6.02 R11.2
  Bottom 0.152: v120.93,10.67 120.93,13.56 119.79,14.71 119.79,28.04 134.95,43.2 134.95,69.11 136.47,70.64 ESP32.J3_12
N$20
  Top 0.152: R8.2 138.99,6.02 138.99,10.29 139.9,11.2 139.9,25.45 124.73,40.62 124.73,62.82 126.34,64.43 ESP32.J3_8
N$21
  Top 0.152: R11.1 119.02,6.02 119.02,9.83 117.81,11.05 117.81,31.39 118.95,32.54 LED8.10
N$22  (via drill 0.35)
  Top 0.152: v129.84,6.4 130.23,6.02 130.99,6.02 R9.1 | v129.84,19.81 120.55,29.11 120.55,32.54 LED8.9
  Bottom 0.152: v129.84,19.81 v129.84,6.4
N$23
  Top 0.152: R12.1 137.01,12.04 136.4,12.04 123.9,24.54 121.61,24.54 119.02,21.95 119.02,21.49 LED8.1
N$24
  Top 0.152: R13.1 130.99,12.04 130.99,16.99 123.75,24.23 121.77,24.23 120.55,23.01 120.55,21.49 LED8.2
N$25
  Top 0.152: R10.1 125.04,6.02 125.04,10.21 123.52,11.73 123.52,21.41 LED8.4
N$26  (via drill 0.35)
  Top 0.152: v125.12,18.67 125.12,12.04 R14.1 | v125.81,28.19 125.81,31.77 125.04,32.54 LED8.6
  Bottom 0.152: v125.12,18.67 125.12,19.28 125.81,19.96 v125.81,28.19
N$27  (via drill 0.35)
  Top 0.152: v120.4,15.01 119.1,13.72 119.1,12.04 R15.1 | v125.2,28.88 125.2,30.79 123.44,32.54 LED8.7
  Bottom 0.152: v120.4,15.01 125.2,19.81 v125.2,28.88
N$32  (via drill 0.35)
  Top 0.152: v25.07,8.31 25.07,5.03 C5.1 | R5.1 25.07,10.97 v25.07,9.68 25.53,9.22 44.81,9.22 45.8,10.21 51.97,10.21 SW2.2 52.05,10.29 52.35,10.59 v53.34,10.59
  Bottom 0.152: v25.07,9.68 v25.07,8.31 | v53.34,10.59 101.42,10.59 131.37,40.54 131.37,45.26 ESP32.J2_10
N$33  (via drill 0.35)
  Top 0.152: v16,6.17 16.99,5.18 16.99,5.03 C6.1 | R6.1 16.99,10.97 16.61,10.59 v16.61,9.68 24.16,9.68 24.92,8.91 110.64,8.91 111.94,10.21 SW3.2 112.01,10.29 v112.01,19.96
  Bottom 0.152: v16,6.17 16,9.07 v16.61,9.68 | v112.01,19.96 112.01,20.73 133.96,42.67 133.96,45.26 ESP32.J2_11
N$34  (via drill 0.35)
  Top 0.152: v32.99,8.31 32.99,5.03 C7.1 | v32,9.83 32,9.98 32.99,10.97 R4.1 33.07,10.97 34.06,9.98 35.66,9.98 36.88,11.2 74.83,11.2 75.74,10.29 81.92,10.29 SW1.2 81.99,10.29 82.91,11.2 v101.12,11.2
  Bottom 0.152: v32.99,8.31 32.99,8.84 v32,9.83 | v101.12,11.2 128.85,38.94 128.85,45.26 ESP32.J2_9
S8
  Top 0.152: 92.32,29.83 92.73,29.41 98.83,29.41 101.5,32.08 101.5,32.54 LED6.7 101.58,32.61 101.58,32.77 102.41,33.6 111.56,33.6 111.71,33.45 111.71,33.38 112.47,32.61 LED7.7 | 92.32,29.83 90.53,31.62 90.53,32.54 LED5.7 | 46.44,30.75 46.48,30.79 46.48,32.54 LED1.7 46.48,32.61 46.48,33.3 33.38,46.41 32.69,46.41 MAX_IC.10 | 46.44,30.75 45.49,29.79 38.18,29.79 36.27,31.7 36.27,31.77 35.51,32.54 LED0.7 | 46.44,30.75 47.78,29.41 54.41,29.41 56.69,31.7 56.69,31.77 57.45,32.54 LED2.7 57.15,32.16 59.89,29.41 65.46,29.41 66.48,30.44 | 66.48,30.44 68.43,32.38 68.43,32.54 LED3.7 | 79.44,30.82 74.91,26.29 70.64,26.29 66.48,30.44 | 79.44,30.82 79.48,30.86 79.48,32.54 LED4.7 | 92.32,29.83 89.38,26.9 83.36,26.9 79.44,30.82